# Altium schematic sheet Main_Cont_3.SchDoc
size A4; DocumentNumber: 17; SheetNumber: 17; SheetTotal: 28
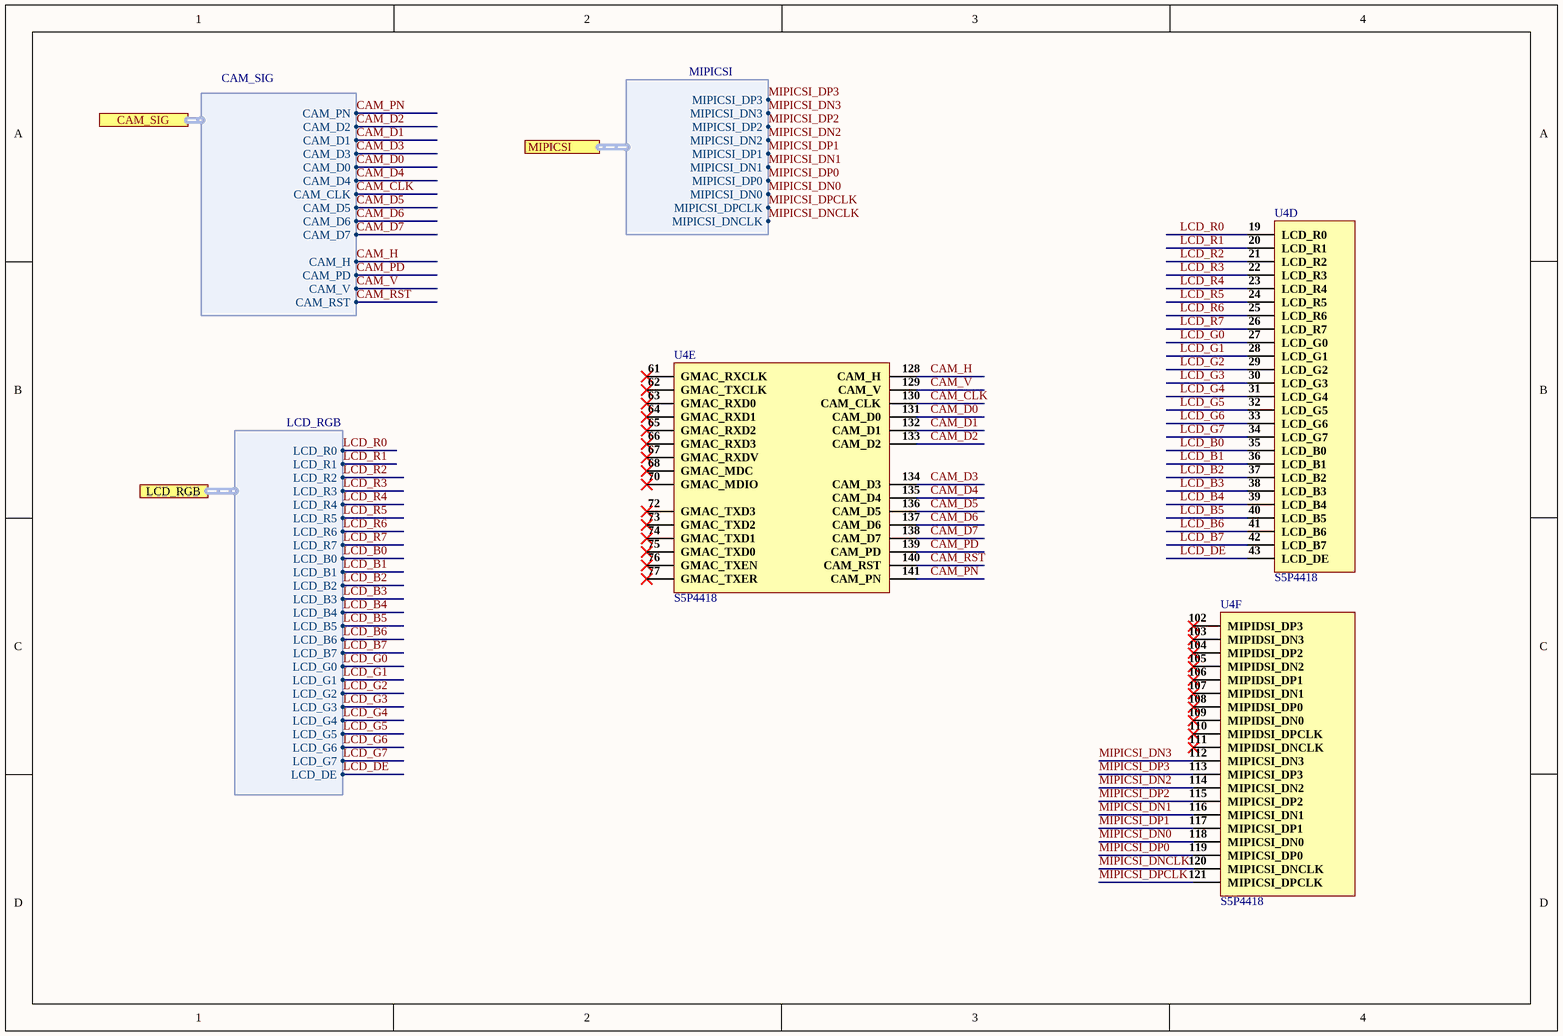
[diagram p0: Main_Cont_3.SchDoc]

## Parts
U4  S5P4418  [S5P4418]  (parts D,E,F of 6)

## Ports
CAM_SIG (harness CAM_SIG), LCD_RGB (harness LCD_RGB), MIPICSI (harness MIPICSI)

## Harnesses
CAM_SIG: CAM_PN, CAM_D2, CAM_D1, CAM_D3, CAM_D4, CAM_D5, CAM_D6, CAM_D7, CAM_H, CAM_PD, CAM_V, CAM_RST, CAM_CLK, CAM_D0
LCD_RGB: LCD_R0, LCD_R1, LCD_R2, LCD_R3, LCD_R5, LCD_R7, LCD_R6, LCD_R4, LCD_B0, LCD_B2, LCD_B4, LCD_B5, LCD_B6, LCD_B7, LCD_B3, LCD_B1, LCD_G0, LCD_G1, LCD_G2, LCD_G3, LCD_G4, LCD_G5, LCD_G6, LCD_G7, LCD_DE
MIPICSI: MIPICSI_DP3, MIPICSI_DN3, MIPICSI_DP2, MIPICSI_DN2, MIPICSI_DP1, MIPICSI_DN1, MIPICSI_DP0, MIPICSI_DN0, MIPICSI_DPCLK, MIPICSI_DNCLK

## Nets
CAM_CLK: U4.130(CAM_CLK) ; port CAM_SIG.CAM_CLK
CAM_D0: U4.131(CAM_D0) ; port CAM_SIG.CAM_D0
CAM_D1: U4.132(CAM_D1) ; port CAM_SIG.CAM_D1
CAM_D2: U4.133(CAM_D2) ; port CAM_SIG.CAM_D2
CAM_D3: U4.134(CAM_D3) ; port CAM_SIG.CAM_D3
CAM_D4: U4.135(CAM_D4) ; port CAM_SIG.CAM_D4
CAM_D5: U4.136(CAM_D5) ; port CAM_SIG.CAM_D5
CAM_D6: U4.137(CAM_D6) ; port CAM_SIG.CAM_D6
CAM_D7: U4.138(CAM_D7) ; port CAM_SIG.CAM_D7
CAM_H: U4.128(CAM_H) ; port CAM_SIG.CAM_H
CAM_PD: U4.139(CAM_PD) ; port CAM_SIG.CAM_PD
CAM_PN: U4.141(CAM_PN) ; port CAM_SIG.CAM_PN
CAM_RST: U4.140(CAM_RST) ; port CAM_SIG.CAM_RST
CAM_V: U4.129(CAM_V) ; port CAM_SIG.CAM_V
LCD_B0: U4.35(LCD_B0) ; port LCD_RGB.LCD_B0
LCD_B1: U4.36(LCD_B1) ; port LCD_RGB.LCD_B1
LCD_B2: U4.37(LCD_B2) ; port LCD_RGB.LCD_B2
LCD_B3: U4.38(LCD_B3) ; port LCD_RGB.LCD_B3
LCD_B4: U4.39(LCD_B4) ; port LCD_RGB.LCD_B4
LCD_B5: U4.40(LCD_B5) ; port LCD_RGB.LCD_B5
LCD_B6: U4.41(LCD_B6) ; port LCD_RGB.LCD_B6
LCD_B7: U4.42(LCD_B7) ; port LCD_RGB.LCD_B7
LCD_DE: U4.43(LCD_DE) ; port LCD_RGB.LCD_DE
LCD_G0: U4.27(LCD_G0) ; port LCD_RGB.LCD_G0
LCD_G1: U4.28(LCD_G1) ; port LCD_RGB.LCD_G1
LCD_G2: U4.29(LCD_G2) ; port LCD_RGB.LCD_G2
LCD_G3: U4.30(LCD_G3) ; port LCD_RGB.LCD_G3
LCD_G4: U4.31(LCD_G4) ; port LCD_RGB.LCD_G4
LCD_G5: U4.32(LCD_G5) ; port LCD_RGB.LCD_G5
LCD_G6: U4.33(LCD_G6) ; port LCD_RGB.LCD_G6
LCD_G7: U4.34(LCD_G7) ; port LCD_RGB.LCD_G7
LCD_R0: U4.19(LCD_R0) ; port LCD_RGB.LCD_R0
LCD_R1: U4.20(LCD_R1) ; port LCD_RGB.LCD_R1
LCD_R2: U4.21(LCD_R2) ; port LCD_RGB.LCD_R2
LCD_R3: U4.22(LCD_R3) ; port LCD_RGB.LCD_R3
LCD_R4: U4.23(LCD_R4) ; port LCD_RGB.LCD_R4
LCD_R5: U4.24(LCD_R5) ; port LCD_RGB.LCD_R5
LCD_R6: U4.25(LCD_R6) ; port LCD_RGB.LCD_R6
LCD_R7: U4.26(LCD_R7) ; port LCD_RGB.LCD_R7
MIPICSI_DN0: U4.118(MIPICSI_DN0) ; port MIPICSI.MIPICSI_DN0
MIPICSI_DN1: U4.116(MIPICSI_DN1) ; port MIPICSI.MIPICSI_DN1
MIPICSI_DN2: U4.114(MIPICSI_DN2) ; port MIPICSI.MIPICSI_DN2
MIPICSI_DN3: U4.112(MIPICSI_DN3) ; port MIPICSI.MIPICSI_DN3
MIPICSI_DNCLK: U4.120(MIPICSI_DNCLK) ; port MIPICSI.MIPICSI_DNCLK
MIPICSI_DP0: U4.119(MIPICSI_DP0) ; port MIPICSI.MIPICSI_DP0
MIPICSI_DP1: U4.117(MIPICSI_DP1) ; port MIPICSI.MIPICSI_DP1
MIPICSI_DP2: U4.115(MIPICSI_DP2) ; port MIPICSI.MIPICSI_DP2
MIPICSI_DP3: U4.113(MIPICSI_DP3) ; port MIPICSI.MIPICSI_DP3
MIPICSI_DPCLK: U4.121(MIPICSI_DPCLK) ; port MIPICSI.MIPICSI_DPCLK

Not connected (* = marked no-connect by the designer): U4 61(GMAC_RXCLK)* 62(GMAC_TXCLK)* 63(GMAC_RXD0)* 64(GMAC_RXD1)* 65(GMAC_RXD2)* 66(GMAC_RXD3)* 67(GMAC_RXDV)* 68(GMAC_MDC)* 70(GMAC_MDIO)* 72(GMAC_TXD3)* 73(GMAC_TXD2)* 74(GMAC_TXD1)* 75(GMAC_TXD0)* 76(GMAC_TXEN)* 77(GMAC_TXER)* 102(MIPIDSI_DP3)* 103(MIPIDSI_DN3)* 104(MIPIDSI_DP2)* 105(MIPIDSI_DN2)* 106(MIPIDSI_DP1)* 107(MIPIDSI_DN1)* 108(MIPIDSI_DP0)* 109(MIPIDSI_DN0)* 110(MIPIDSI_DPCLK)* 111(MIPIDSI_DNCLK)*

## Library data of the parts
U4 = S5P4418: S5P4418 Quad Core Android SoM System on Module; Manufacturer: Samsung; Value: Custom; Manufacturer Part No: S5P4418; Package: Custom